# Altium project RK3566_.PrjPcb (part 4 of 6)
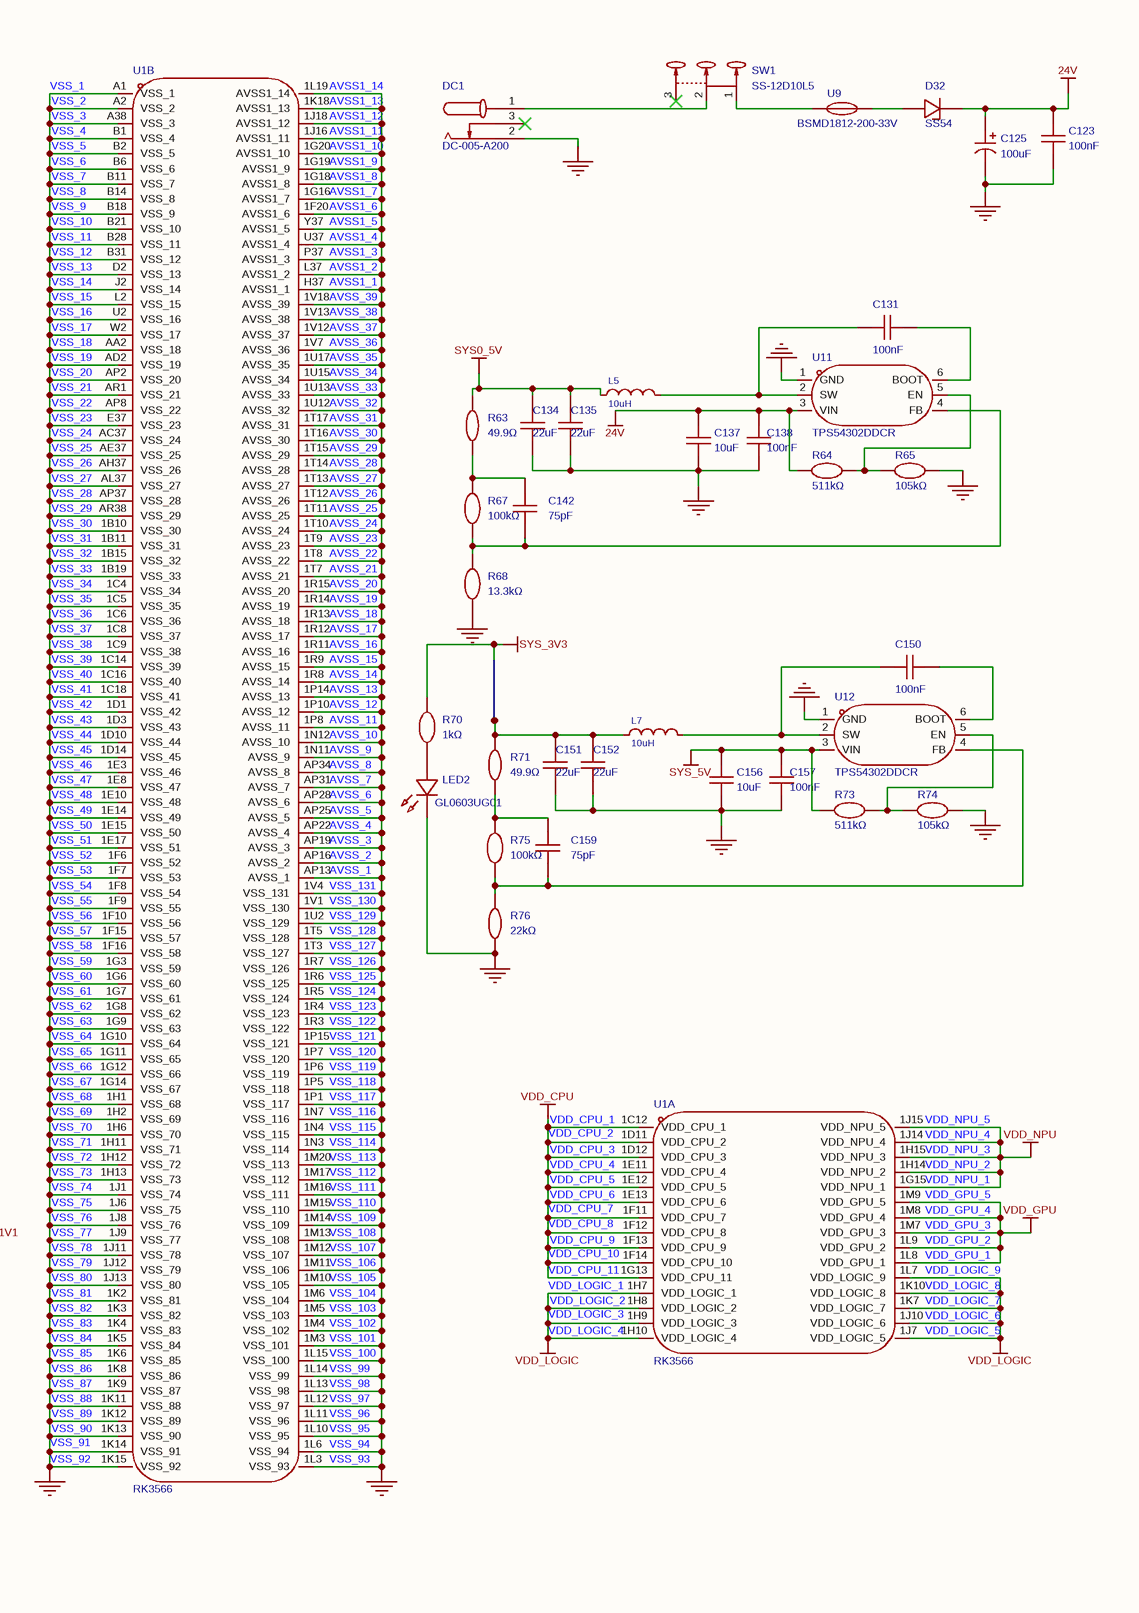
[diagram p112: 板载电源.schdoc, right]

## Sheet 板载电源.schdoc (continued)

### Library data of the parts
C120 C126 = FCC0402N180J500AT: 容值:18pF;精度:±5%;额定电压:50V;温度系数:C0G;; Manufacturer: FOJAN(富捷); AddInBom: yes; ModelId: 36a51122f27c49738f86b3bfa98863e0聨0819f05c4eef4c71ace90d822a990e87; ModelName: C0402_L1.0-W0.5-H0.5; ModelTransform: 39.37,19.685,0,0,0,0,0,0,0; Tolerance: ±5%; Voltage Rating: 50V; Temperature Coefficient: C0G; Symbol: FCC0402N180J500AT; Device: FCC0402N180J500AT; LCSC Part Name: 18pF ±5% 50V; SupplierPart: C5137554; ManufacturerPart: FCC0402N180J500AT; Supplier Footprint: 0402; JLCPCB Part Class: Extended Part; Datasheet: https://item.szlcsc.com/datasheet/FCC0402N180J500AT/5747006.html; Supplier: LCSC; ConvertToPcb: yes; FootprintName: C0402; Value: 18pF; Operating Temperature: -55℃~+125℃
C121 C124 C128 C130 C133 C139 C145 C154 C161 C165 C170 C175 C178 = HGC0402R5106M100NTEJ: as C118 on sheet WIFI_BT PHY; Symbol: HGC0402R5106M100NTEJ; Device: HGC0402R5106M100NTEJ; LCSC Part Name: 10uF ±20% 10V; Supplier Part: C7472949; Manufacturer Part: HGC0402R5106M100NTEJ; Supplier Footprint: 0402; JLCPCB Part Class: Extended Part; Datasheet: https://item.szlcsc.com/datasheet/HGC0402R5106M100NTEJ/8532796.html; Supplier: LCSC; Value: 10uF; ConvertToPcb: yes; FootprintName: C0402
C122 C132 C136 C140 C144 C147 C188 C190 = HGC0402R5105K500NTEJ: as C112 on sheet WIFI_BT PHY; Symbol: HGC0402R5105K500NTEJ; Device: HGC0402R5105K500NTEJ; LCSC Part Name: 1uF ±10% 50V; Supplier Part: C7472948; Manufacturer Part: HGC0402R5105K500NTEJ; Supplier Footprint: 0402; JLCPCB Part Class: Extended Part; Datasheet: https://item.szlcsc.com/datasheet/HGC0402R5105K500NTEJ/8532795.html; Supplier: LCSC; Value: 1uF; ConvertToPcb: yes; FootprintName: C0402
C123 = FCC0603B104K500CT: 容值:100nF;精度:±10%;额定电压:50V;温度系数:X7R;; Manufacturer: FOJAN(富捷); AddInBom: yes; ModelId: ac125912035d415993ca9572d50418b1聨0819f05c4eef4c71ace90d822a990e87; ModelName: C0603_L1.6-W0.8-H0.8; ModelTransform: 62.992,31.496,0,0,0,0,0,0,0; Tolerance: ±10%; Voltage Rating: 50V; Temperature Coefficient: X7R; Symbol: FCC0603B104K500CT; Device: FCC0603B104K500CT; LCSC Part Name: 100nF ±10% 50V; SupplierPart: C5137636; ManufacturerPart: FCC0603B104K500CT; Supplier Footprint: 0603; JLCPCB Part Class: Extended Part; Datasheet: https://item.szlcsc.com/datasheet/FCC0603B104K500CT/5747088.html; Supplier: LCSC; ConvertToPcb: yes; FootprintName: C0603; Value: 100nF; Operating Temperature: -55℃~+125℃
C125 = RVE100UF35V67RV0072: 容值:100uF;精度:±20%;额定电压:35V;纹波电流:230mA@120Hz;等效串联电阻(ESR):600mΩ@100kHz;; Manufacturer: KNSCHA(科尼盛); AddInBom: yes; ModelId: e9bf03a505e14561b78f20847edc0c03聨0819f05c4eef4c71ace90d822a990e87; ModelTransform: 283.464,259.842,0,180,0,0,0,0,0; Tolerance: ±20%; Voltage Rating: 35V; Lifetime: 2000hrs@105℃; Symbol: RVE100UF35V67RV0072; Device: RVE100UF35V67RV0072; LCSC Part Name: 100uF ±20% 35V; SupplierPart: C2836437; ManufacturerPart: RVE100UF35V67RV0072; Supplier Footprint: SMD,D6.3xL7.7mm; JLCPCB Part Class: Extended Part; Datasheet: https://item.szlcsc.com/datasheet/RVE100UF35V67RV0072/3002609.html; Supplier: LCSC; ConvertToPcb: yes; FootprintName: CAP-SMD_BD6.3-L6.6-W6.6-LS7.6-FD-1; ModelName: CAP-SMD_BD6.3-L6.6-W6.6-LS7.6-FD-1; Value: 100uF; Ripple Current: 230mA@120Hz; Equivalent Series Resistance(ESR): 600mΩ@100kHz; Diameter: 6.3mm; Height - Seated (Max): 7.7mm; Operating Temperature: -55℃~+105℃
C127 C129 = HGC0402R5106M100NTEJ: 容值:10uF;精度:±20%;额定电压:10V;温度系数:X5R;; Manufacturer: Chinocera(华瓷); AddInBom: yes; ModelId: 36a51122f27c49738f86b3bfa98863e0聨0819f05c4eef4c71ace90d822a990e87; ModelName: C0402_L1.0-W0.5-H0.5; ModelTransform: 39.37,19.685,0,0,0,0,0,0,0; Tolerance: ±20%; Voltage Rating: 10V; Temperature Coefficient: X5R; Symbol: HGC0402R5106M100NTEJ; Device: HGC0402R5106M100NTEJ; LCSC Part Name: 10uF ±20% 10V; SupplierPart: C7472949; ManufacturerPart: HGC0402R5106M100NTEJ; Supplier Footprint: 0402; JLCPCB Part Class: Extended Part; Datasheet: https://item.szlcsc.com/datasheet/HGC0402R5106M100NTEJ/8532796.html; Supplier: LCSC; ConvertToPcb: yes; FootprintName: C0402; Value: 10uF
C131 C138 C150 C157 = FCC0603B104K500CT: 容值:100nF;精度:±10%;额定电压:50V;温度系数:X7R;; Manufacturer: FOJAN(富捷); 3D Model: ac125912035d415993ca9572d50418b1聨0819f05c4eef4c71ace90d822a990e87; 3D Model Transform: 62.992,31.496,0,0,0,0,0,0,0; Tolerance: ±10%; Voltage Rating: 50V; Temperature Coefficient: X7R; AddInBom: yes; ModelName: C0603_L1.6-W0.8-H0.8; Symbol: FCC0603B104K500CT; Device: FCC0603B104K500CT; LCSC Part Name: 100nF ±10% 50V; Supplier Part: C5137636; Manufacturer Part: FCC0603B104K500CT; Supplier Footprint: 0603; JLCPCB Part Class: Extended Part; Datasheet: https://item.szlcsc.com/datasheet/FCC0603B104K500CT/5747088.html; Supplier: LCSC; Value: 100nF; Operating Temperature: -55℃~+125℃; ConvertToPcb: yes; FootprintName: C0603
C134 C135 C151 C152 = HGC0603R5226M100NTHJ: 容值:22uF;精度:±20%;额定电压:10V;温度系数:X5R;; Manufacturer: Chinocera(华瓷); AddInBom: yes; ModelId: ac125912035d415993ca9572d50418b1聨0819f05c4eef4c71ace90d822a990e87; ModelName: C0603_L1.6-W0.8-H0.8; ModelTransform: 62.992,31.496,0,0,0,0,0,0,0; Tolerance: ±20%; Voltage Rating: 10V; Temperature Coefficient: X5R; Symbol: HGC0603R5226M100NTHJ; Device: HGC0603R5226M100NTHJ; LCSC Part Name: 22uF ±20% 10V; SupplierPart: C7432770; ManufacturerPart: HGC0603R5226M100NTHJ; Supplier Footprint: 0603; JLCPCB Part Class: Extended Part; Datasheet: https://item.szlcsc.com/datasheet/HGC0603R5226M100NTHJ/8438252.html; Supplier: LCSC; ConvertToPcb: yes; FootprintName: C0603; Value: 22uF
C137 C156 = HGC0603R5106M350NTHJ: 容值:10uF;精度:±20%;额定电压:35V;温度系数:X5R;; Manufacturer: Chinocera(华瓷); AddInBom: yes; ModelId: ac125912035d415993ca9572d50418b1聨0819f05c4eef4c71ace90d822a990e87; ModelName: C0603_L1.6-W0.8-H0.8; ModelTransform: 62.992,31.496,0,0,0,0,0,0,0; Tolerance: ±20%; Voltage Rating: 35V; Temperature Coefficient: X5R; Symbol: HGC0603R5106M350NTHJ; Device: HGC0603R5106M350NTHJ; LCSC Part Name: 10uF ±20% 35V; SupplierPart: C22367827; ManufacturerPart: HGC0603R5106M350NTHJ; Supplier Footprint: 0603; JLCPCB Part Class: Extended Part; Datasheet: https://item.szlcsc.com/datasheet/HGC0603R5106M350NTHJ/23841132.html; Supplier: LCSC; ConvertToPcb: yes; FootprintName: C0603; Value: 10uF
C141 C143 C146 C158 C163 C164 C168 C172 C173 = CL05B104KO5NNNC: as C113 on sheet WIFI_BT PHY; Symbol: CL05B104KO5NNNC; Device: CL05B104KO5NNNC; LCSC Part Name: 100nF ±10% 16V; Supplier Part: C1525; Manufacturer Part: CL05B104KO5NNNC; Supplier Footprint: 0402; JLCPCB Part Class: Basic Part; Datasheet: https://item.szlcsc.com/datasheet/CL05B104KO5NNNC/1877.html; Supplier: LCSC; Value: 100nF; ConvertToPcb: yes; FootprintName: C0402
C142 C159 = CC0603JRNPO9BN750: 容值:75pF;精度:±5%;额定电压:50V;温度系数:NP0;; Manufacturer: YAGEO(国巨); AddInBom: yes; ModelId: ac125912035d415993ca9572d50418b1聨0819f05c4eef4c71ace90d822a990e87; ModelName: C0603_L1.6-W0.8-H0.8; ModelTransform: 62.992,31.496,0,0,0,0,0,0,0; Tolerance: ±5%; Voltage Rating: 50V; Temperature Coefficient: NP0; Symbol: CC0603JRNPO9BN750; Device: CC0603JRNPO9BN750; LCSC Part Name: 75pF ±5% 50V; SupplierPart: C282074; ManufacturerPart: CC0603JRNPO9BN750; Supplier Footprint: 0603; JLCPCB Part Class: Extended Part; Datasheet: https://item.szlcsc.com/datasheet/CC0603JRNPO9BN750/268161.html; Supplier: LCSC; ConvertToPcb: yes; FootprintName: C0603; Value: 75pF
C148 C149 = CL05A225MQ5NSNC: 容值:2.2uF;精度:±20%;额定电压:6.3V;温度系数:X5R;; Manufacturer: SAMSUNG(三星); AddInBom: yes; ModelId: 36a51122f27c49738f86b3bfa98863e0聨0819f05c4eef4c71ace90d822a990e87; ModelName: C0402_L1.0-W0.5-H0.5; ModelTransform: 39.37,19.685,0,0,0,0,0,0,0; Tolerance: ±20%; Voltage Rating: 6.3V; Temperature Coefficient: X5R; Symbol: CL05A225MQ5NSNC; Device: CL05A225MQ5NSNC; LCSC Part Name: 2.2uF ±20% 6.3V; SupplierPart: C12530; ManufacturerPart: CL05A225MQ5NSNC; Supplier Footprint: 0402; JLCPCB Part Class: Basic Part; Datasheet: https://item.szlcsc.com/datasheet/CL05A225MQ5NSNC/13164.html; Supplier: LCSC; ConvertToPcb: yes; FootprintName: C0402; Value: 2.2uF
C153 C160 C166 C167 C169 C174 C177 = HGC0603R5226M100NTHJ: 容值:22uF;精度:±20%;额定电压:10V;温度系数:X5R;; Manufacturer: Chinocera(华瓷); 3D Model: ac125912035d415993ca9572d50418b1聨0819f05c4eef4c71ace90d822a990e87; 3D Model Transform: 62.992,31.496,0,0,0,0,0,0,0; Tolerance: ±20%; Voltage Rating: 10V; Temperature Coefficient: X5R; AddInBom: yes; ModelName: C0603_L1.6-W0.8-H0.8; Symbol: HGC0603R5226M100NTHJ; Device: HGC0603R5226M100NTHJ; LCSC Part Name: 22uF ±20% 10V; Supplier Part: C7432770; Manufacturer Part: HGC0603R5226M100NTHJ; Supplier Footprint: 0603; JLCPCB Part Class: Extended Part; Datasheet: https://item.szlcsc.com/datasheet/HGC0603R5226M100NTHJ/8438252.html; Supplier: LCSC; Value: 22uF; ConvertToPcb: yes; FootprintName: C0603
C155 C162 C171 C176 C179 = CL05B104KO5NNNC: 容值:100nF;精度:±10%;额定电压:16V;温度系数:X7R;; Manufacturer: SAMSUNG(三星); AddInBom: yes; ModelId: 36a51122f27c49738f86b3bfa98863e0聨0819f05c4eef4c71ace90d822a990e87; ModelName: C0402_L1.0-W0.5-H0.5; ModelTransform: 39.37,19.685,0,0,0,0,0,0,0; Tolerance: ±10%; Voltage Rating: 16V; Temperature Coefficient: X7R; Symbol: CL05B104KO5NNNC; Device: CL05B104KO5NNNC; LCSC Part Name: 100nF ±10% 16V; SupplierPart: C1525; ManufacturerPart: CL05B104KO5NNNC; Supplier Footprint: 0402; JLCPCB Part Class: Basic Part; Datasheet: https://item.szlcsc.com/datasheet/CL05B104KO5NNNC/1877.html; Supplier: LCSC; ConvertToPcb: yes; FootprintName: C0402; Value: 100nF
C180-C187 C189 = HGC0402R5105K500NTEJ: 容值:1uF;精度:±10%;额定电压:50V;温度系数:X5R;; Manufacturer: Chinocera(华瓷); AddInBom: yes; ModelId: 36a51122f27c49738f86b3bfa98863e0聨0819f05c4eef4c71ace90d822a990e87; ModelName: C0402_L1.0-W0.5-H0.5; ModelTransform: 39.37,19.685,0,0,0,0,0,0,0; Tolerance: ±10%; Voltage Rating: 50V; Temperature Coefficient: X5R; Symbol: HGC0402R5105K500NTEJ; Device: HGC0402R5105K500NTEJ; LCSC Part Name: 1uF ±10% 50V; SupplierPart: C7472948; ManufacturerPart: HGC0402R5105K500NTEJ; Supplier Footprint: 0402; JLCPCB Part Class: Extended Part; Datasheet: https://item.szlcsc.com/datasheet/HGC0402R5105K500NTEJ/8532795.html; Supplier: LCSC; ConvertToPcb: yes; FootprintName: C0402; Value: 1uF
D32 = SS54_C7420369: 二极管配置:1个独立式;正向压降(Vf):550mV@5A;直流反向耐压(Vr):40V;整流电流:5A;; Manufacturer: R+O(宏嘉诚); AddInBom: yes; ModelId: 7e24bebe6cd74171ae8c9de6fc5b78aa聨0819f05c4eef4c71ace90d822a990e87; ModelTransform: 198.4248,103.5431,0,180,0,0,-0.001,0,0; Diode Configuration: 1个独立式; Voltage - DC Reverse(Vr): 40V; Current - Rectified: 5A; Reverse Leakage Current (Ir): 200uA@40V; Operating Junction Temperature Range: -55℃~+125℃; Non-Repetitive Peak Forward Surge Current: 120A; Symbol: SS54_C7420369; Device: SS54_C7420369; LCSC Part Name: 电压:40V 电流:5A; SupplierPart: C7420369; ManufacturerPart: SS54; Supplier Footprint: SMA(DO-214AC); JLCPCB Part Class: Extended Part; Datasheet: https://item.szlcsc.com/datasheet/SS54/8397191.html; Supplier: LCSC; ConvertToPcb: yes; FootprintName: SMA_L4.3-W2.6-LS5.0-FD; ModelName: SMA_L4.3-W2.6-LS5.0-FD; Voltage - Forward(Vf@If): 550mV@5A; Power Dissipation: -
D33 = BAT54CT-TP: 二极管配置:1对共阴极;正向压降(Vf):1V@100mA;直流反向耐压(Vr):30V;整流电流:200mA;; Manufacturer: MCC(美微科); AddInBom: yes; ModelId: 3e7fadd59d8d474faa89c2c7e0676879聨0819f05c4eef4c71ace90d822a990e87; ModelName: SOT-523-3P_L1.6-W0.8-H0.9-LS1.6-P0.50; ModelTransform: 63.48633,62.992,0,180,0,0,0,0,0; Diode Configuration: 1对共阴极; Voltage - DC Reverse(Vr): 30V; Current - Rectified: 200mA; Reverse Leakage Current (Ir): 2uA@25V; Symbol: BAT54CT-TP; Device: BAT54CT-TP; LCSC Part Name: 电压:30V 电流:200mA; SupplierPart: C725562; ManufacturerPart: BAT54CT-TP; Supplier Footprint: SOT-523-3; JLCPCB Part Class: Extended Part; Datasheet: https://item.szlcsc.com/datasheet/BAT54CT-TP/771875.html; Supplier: LCSC; ConvertToPcb: yes; FootprintName: SOT-523-3_L1.6-W0.8-P1.00-LS1.6-BR; Voltage - Forward(Vf@If): 1V@100mA
DC1 = DC-005-A200: 连接器类型:DC电源插座;安装方式:弯插;触点内径:2mm;触点外径:6.4mm;额定电流:3A;额定电压:30V;工作温度:-20℃~+70℃;; Manufacturer: XUNPU(讯普); AddInBom: yes; ModelId: 1321cdbe1dc84555a9684967491c8670聨0819f05c4eef4c71ace90d822a990e87; ModelTransform: 553.149,368.14887,0,0,0,0,-137.795,85.63,-161.417; Connector Type: DC电源插座; Inside Contact Diameter: 2mm; Outside Contact Diameter: 6.4mm; Current Rating: 3A; Voltage Rating (Max): 30V; Body Height: 11mm; Symbol: DC-005-A200; Device: DC-005-A200; LCSC Part Name: DC电源插座 内径:2mm 外径:6.4mm; SupplierPart: C720557; ManufacturerPart: DC-005-A200; Supplier Footprint: 插件; JLCPCB Part Class: Extended Part; Datasheet: https://item.szlcsc.com/datasheet/DC-005-A200/763564.html; Supplier: LCSC; ConvertToPcb: yes; FootprintName: DC-IN-TH_DC-005-A200; ModelName: DC-IN-TH_DC-005-A200; Mounting Type: 弯插; Length: 14mm; Width: 9mm; Operating Temperature: -20℃~+70℃
L5 L7 = PNR3015-100-M: 电感值:10uH;精度:±20%;额定电流:900mA;饱和电流(Isat):920mA;类型:磁胶屏蔽电感;; Manufacturer: JIERR(捷而瑞); AddInBom: yes; ModelId: 383ff80ba23841c7ae1294cf4d0706db聨0819f05c4eef4c71ace90d822a990e87; ModelTransform: 118.11,118.11394,0,0,0,0,-0.005,0,0; Tolerance: ±20%; Current Rating: 900mA; Current - Saturation(Isat): 920mA; DC Resistance(DCR): 250mΩ; Type: 磁胶屏蔽电感; Symbol: PNR3015-100-M; Device: PNR3015-100-M; LCSC Part Name: 10uH±20% 0.92A; SupplierPart: C55381747; ManufacturerPart: PNR3015-100-M; Supplier Footprint: SMD,3x3mm; JLCPCB Part Class: Extended Part; Datasheet: https://item.szlcsc.com/datasheet/PNR3015-100-M/59339375.html; Supplier: LCSC; ConvertToPcb: yes; FootprintName: IND-SMD_L3.0-W3.0_MAI3015S; ModelName: IND-SMD_L3.0-W3.0_MAI3015S; Value: 10uH
L6 L8 L10-L12 = PCT201210-R47-M: 小型化一体成型T-CORE，小体积，扁线工艺，感值小; Manufacturer: JIERR(捷而瑞); AddInBom: yes; Tolerance: ±20%; Current Rating: 3.8A; Current - Saturation(Isat): 4.7A; DC Resistance(DCR): 35mΩ; Type: 一体成型电感; Symbol: PCT201210-R47-M; Device: PCT201210-R47-M; LCSC Part Name: 0.47μH ±20% 4.7A; SupplierPart: C54557068; ManufacturerPart: PCT201210-R47-M; Supplier Footprint: 0805; JLCPCB Part Class: Extended Part; Datasheet: https://item.szlcsc.com/datasheet/PCT201210-R47-M/57921656.html; Supplier: LCSC; ConvertToPcb: yes; FootprintName: IND-SMD_L2.0-W1.2_PCT201210; Value: 470nH
L9 = FTC252010S4R7MBCA: 小型化一体成型T-CORE，小体积，扁线工艺，感值小; Manufacturer: cjiang(长江微电); AddInBom: yes; ModelId: e143e04106934774881cec608355723f聨0819f05c4eef4c71ace90d822a990e87; ModelTransform: 98.504,78.819,0,0,0,0,-0.004,-0.003,0; Symbol: FTC252010S4R7MBCA; Device: FTC252010S4R7MBCA; LCSC Part Name: 4.7uH ±20% 2.6A; SupplierPart: C5832360; ManufacturerPart: FTC252010S4R7MBCA; Supplier Footprint: 1008; JLCPCB Part Class: Extended Part; Datasheet: https://item.szlcsc.com/datasheet/FTC252010S4R7MBCA/6763480.html; Supplier: LCSC; ConvertToPcb: yes; FootprintName: IND-SMD_L2.5-W2.0-VLS252012CX-150M; ModelName: IND-SMD_L2.5-W2.0-VLS252012CX-150M
LED2 = GL0603UG01: 灯头类型:-;发光颜色:翠绿色;正向压降(Vf):2.7V~3.2V;功率:-;测试电流:20mA;波长:510nm~531nm;二极管配置:独立二极管;透镜颜色:无色透明透镜;色温:-;发光强度:173mcd~350mcd;发光角度:120°;载带方式:正贴;工作温度:-40℃~+85℃;; Manufacturer: Guiguang light(桂光光电); AddInBom: yes; ModelId: 1f0d29a91be547639d425604e9b96ebb聨0819f05c4eef4c71ace90d822a990e87; ModelTransform: 63.7794,32.283,0,0,0,0,0,0,0; Illumination Color: 翠绿色; Test Current: 20mA; Diode Configuration: 独立二极管; Lens Color: 无色透明透镜; Viewing Angle: 120°; Symbol: GL0603UG01; Device: GL0603UG01; LCSC Part Name: 0603 翠绿 高亮; SupplierPart: C51933293; ManufacturerPart: GL0603UG01; Supplier Footprint: 0603; JLCPCB Part Class: Extended Part; Datasheet: https://item.szlcsc.com/datasheet/GL0603UG01/54645989.html; Supplier: LCSC; ConvertToPcb: yes; FootprintName: LED0603-RD; ModelName: LED0603-RD; Lamp Holder Type: -; Voltage - Forward(Vf): 2.7V~3.2V; Power(Watts): -; Wavelength - Dominant: 510nm~531nm; Peak Wavelength: -; Color Temperature: -; Luminous Intensity: 173mcd~350mcd; Mounting Style: 正贴; Operating Temperature: -40℃~+85℃
R57 R66 R69 = FRC0402F1002TS: as R56 on sheet WIFI_BT PHY; Symbol: FRC0402F1002TS; Device: FRC0402F1002TS; LCSC Part Name: 10kΩ ±1% 62.5mW 厚膜电阻; SupplierPart: C2906861; ManufacturerPart: FRC0402F1002TS; Supplier Footprint: 0402; JLCPCB Part Class: Extended Part; Datasheet: https://item.szlcsc.com/datasheet/FRC0402F1002TS/3180374.html; Supplier: LCSC; ConvertToPcb: yes; FootprintName: R0402; Type: 厚膜电阻; Value: 10kΩ; Temperature Coefficient: ±100ppm/℃; Operating Temperature: -55℃~+155℃
R58 = RC0402FR-0722RL: 电阻类型:厚膜电阻;阻值:22Ω;精度:±1%;功率:62.5mW;工作电压:50V;温度系数:±100ppm/℃;; Manufacturer: YAGEO(国巨); AddInBom: yes; ModelId: 98c88bc2b9094f218f3a3e30a7012738聨0819f05c4eef4c71ace90d822a990e87; ModelName: R0402_L1.0-W0.5-H0.4; ModelTransform: 39.37,19.685,0,0,0,0,0,0,0; Tolerance: ±1%; Power(Watts): 62.5mW; Voltage-Supply(Max): 50V; Symbol: RC0402FR-0722RL; Device: RC0402FR-0722RL; LCSC Part Name: 厚膜电阻 22Ω ±1% 62.5mW; SupplierPart: C114765; ManufacturerPart: RC0402FR-0722RL; Supplier Footprint: 0402; JLCPCB Part Class: Extended Part; Datasheet: https://item.szlcsc.com/datasheet/RC0402FR-0722RL/116009.html; Supplier: LCSC; ConvertToPcb: yes; FootprintName: R0402; Type: 厚膜电阻; Value: 22Ω; Temperature Coefficient: ±100ppm/℃; Operating Temperature: -55℃~+155℃
R59 R79 R83 = FRC0402F1002TS: 电阻类型:厚膜电阻;阻值:10kΩ;精度:±1%;功率:62.5mW;工作电压:50V;温度系数:±100ppm/℃;; Manufacturer: FOJAN(富捷); 3D Model: 98c88bc2b9094f218f3a3e30a7012738聨0819f05c4eef4c71ace90d822a990e87; 3D Model Transform: 39.37,19.685,0,0,0,0,0,0,0; Tolerance: ±1%; Power(Watts): 62.5mW; Voltage-Supply(Max): 50V; AddInBom: yes; ModelName: R0402_L1.0-W0.5-H0.4; Symbol: FRC0402F1002TS; Device: FRC0402F1002TS; LCSC Part Name: 10kΩ ±1% 62.5mW 厚膜电阻; Supplier Part: C2906861; Manufacturer Part: FRC0402F1002TS; Supplier Footprint: 0402; JLCPCB Part Class: Extended Part; Datasheet: https://item.szlcsc.com/datasheet/FRC0402F1002TS/3180374.html; Supplier: LCSC; Type: 厚膜电阻; Value: 10kΩ; Temperature Coefficient: ±100ppm/℃; Operating Temperature: -55℃~+155℃; ConvertToPcb: yes; FootprintName: R0402
R60 R61 = 0402WGF1000TCE: 电阻类型:厚膜电阻;阻值:100Ω;精度:±1%;功率:62.5mW;工作电压:50V;温度系数:±100ppm/℃;; Manufacturer: UNI-ROYAL(厚声); AddInBom: yes; ModelId: 98c88bc2b9094f218f3a3e30a7012738聨0819f05c4eef4c71ace90d822a990e87; ModelName: R0402_L1.0-W0.5-H0.4; ModelTransform: 39.37,19.685,0,0,0,0,0,0,0; Tolerance: ±1%; Power(Watts): 62.5mW; Voltage-Supply(Max): 50V; Symbol: 0402WGF1000TCE; Device: 0402WGF1000TCE; LCSC Part Name: 厚膜电阻 100Ω ±1%; SupplierPart: C25076; ManufacturerPart: 0402WGF1000TCE; Supplier Footprint: 0402; JLCPCB Part Class: Basic Part; Datasheet: https://item.szlcsc.com/datasheet/0402WGF1000TCE/25819.html; Supplier: LCSC; ConvertToPcb: yes; FootprintName: R0402; Type: 厚膜电阻; Value: 100Ω; Temperature Coefficient: ±100ppm/℃; Operating Temperature: -55℃~+155℃
R62 = FRC0402F6802TS: 电阻类型:厚膜电阻;阻值:68kΩ;精度:±1%;功率:62.5mW;工作电压:50V;温度系数:±100ppm/℃;; Manufacturer: FOJAN(富捷); AddInBom: yes; ModelId: 98c88bc2b9094f218f3a3e30a7012738聨0819f05c4eef4c71ace90d822a990e87; ModelName: R0402_L1.0-W0.5-H0.4; ModelTransform: 39.37,19.685,0,0,0,0,0,0,0; Tolerance: ±1%; Power(Watts): 62.5mW; Voltage-Supply(Max): 50V; Symbol: FRC0402F6802TS; Device: FRC0402F6802TS; LCSC Part Name: 68kΩ ±1% 62.5mW 厚膜电阻; SupplierPart: C2909379; ManufacturerPart: FRC0402F6802TS; Supplier Footprint: 0402; JLCPCB Part Class: Extended Part; Datasheet: https://item.szlcsc.com/datasheet/FRC0402F6802TS/3186314.html; Supplier: LCSC; ConvertToPcb: yes; FootprintName: R0402; Type: 厚膜电阻; Value: 68kΩ; Temperature Coefficient: ±100ppm/℃; Operating Temperature: -55℃~+155℃
R63 R71 = 0603WAF499JT5E: 电阻类型:厚膜电阻;阻值:49.9Ω;精度:±1%;功率:100mW;工作电压:75V;温度系数:±100ppm/℃;; Manufacturer: UNI-ROYAL(厚声); AddInBom: yes; ModelId: fc143cca1e79419f9cd78b61e9279f08聨0819f05c4eef4c71ace90d822a990e87; ModelTransform: 31.8897,63.7794,0,90,0,0,0,0,0; Tolerance: ±1%; Power(Watts): 100mW; Voltage-Supply(Max): 75V; Symbol: 0603WAF499JT5E; Device: 0603WAF499JT5E; LCSC Part Name: 49.9Ω ±1% 100mW 厚膜电阻; SupplierPart: C23185; ManufacturerPart: 0603WAF499JT5E; Supplier Footprint: 0603; JLCPCB Part Class: Basic Part; Datasheet: https://item.szlcsc.com/datasheet/0603WAF499JT5E/23912.html; Supplier: LCSC; ConvertToPcb: yes; FootprintName: R0603; ModelName: R0603; Type: 厚膜电阻; Value: 49.9Ω; Temperature Coefficient: ±100ppm/℃; Operating Temperature: -55℃~+155℃
R64 R73 = ERJ3EKF5113V: 电阻类型:厚膜电阻;阻值:511kΩ;精度:±1%;功率:100mW;工作电压:75V;温度系数:±100ppm/℃;; Manufacturer: PANASONIC(松下); AddInBom: yes; ModelId: fc143cca1e79419f9cd78b61e9279f08聨0819f05c4eef4c71ace90d822a990e87; ModelTransform: 31.8897,63.7794,0,90,0,0,0,0,0; Tolerance: ±1%; Power(Watts): 100mW; Voltage-Supply(Max): 75V; Symbol: ERJ3EKF5113V; Device: ERJ3EKF5113V; LCSC Part Name: 厚膜电阻 511kΩ ±1% 100mW; SupplierPart: C403259; ManufacturerPart: ERJ3EKF5113V; Supplier Footprint: 0603; JLCPCB Part Class: Extended Part; Datasheet: https://item.szlcsc.com/datasheet/ERJ3EKF5113V/389058.html; Supplier: LCSC; ConvertToPcb: yes; FootprintName: R0603; ModelName: R0603; Type: 厚膜电阻; Value: 511kΩ; Temperature Coefficient: ±100ppm/℃; Operating Temperature: -55℃~+155℃
R65 R74 = FRC0603F1053TS: 电阻类型:厚膜电阻;阻值:105kΩ;精度:±1%;功率:100mW;工作电压:75V;温度系数:±100ppm/℃;; Manufacturer: FOJAN(富捷); AddInBom: yes; ModelId: fc143cca1e79419f9cd78b61e9279f08聨0819f05c4eef4c71ace90d822a990e87; ModelTransform: 31.8897,63.7794,0,90,0,0,0,0,0; Tolerance: ±1%; Power(Watts): 100mW; Voltage-Supply(Max): 75V; Symbol: FRC0603F1053TS; Device: FRC0603F1053TS; LCSC Part Name: 105kΩ ±1% 100mW 厚膜电阻; SupplierPart: C2933128; ManufacturerPart: FRC0603F1053TS; Supplier Footprint: 0603; JLCPCB Part Class: Extended Part; Supplier: LCSC; ConvertToPcb: yes; FootprintName: R0603; ModelName: R0603; Type: 厚膜电阻; Value: 105kΩ; Temperature Coefficient: ±100ppm/℃; Operating Temperature: -55℃~+155℃
R67 R75 = FRC0603F1003TS: 电阻类型:厚膜电阻;阻值:100kΩ;精度:±1%;功率:100mW;工作电压:75V;温度系数:±100ppm/℃;; Manufacturer: FOJAN(富捷); AddInBom: yes; ModelId: fc143cca1e79419f9cd78b61e9279f08聨0819f05c4eef4c71ace90d822a990e87; ModelTransform: 31.8897,63.7794,0,90,0,0,0,0,0; Tolerance: ±1%; Power(Watts): 100mW; Voltage-Supply(Max): 75V; Symbol: FRC0603F1003TS; Device: FRC0603F1003TS; LCSC Part Name: 100kΩ ±1% 100mW 厚膜电阻; SupplierPart: C2906980; ManufacturerPart: FRC0603F1003TS; Supplier Footprint: 0603; JLCPCB Part Class: Extended Part; Datasheet: https://item.szlcsc.com/datasheet/FRC0603F1003TS/3180493.html; Supplier: LCSC; ConvertToPcb: yes; FootprintName: R0603; ModelName: R0603; Type: 厚膜电阻; Value: 100kΩ; Temperature Coefficient: ±100ppm/℃; Operating Temperature: -55℃~+155℃
R68 = FRC0603F1332TS: 电阻类型:厚膜电阻;阻值:13.3kΩ;精度:±1%;功率:100mW;工作电压:75V;温度系数:±100ppm/℃;; Manufacturer: FOJAN(富捷); AddInBom: yes; ModelId: fc143cca1e79419f9cd78b61e9279f08聨0819f05c4eef4c71ace90d822a990e87; ModelTransform: 31.8897,63.7794,0,90,0,0,0,0,0; Tolerance: ±1%; Power(Watts): 100mW; Voltage-Supply(Max): 75V; Symbol: FRC0603F1332TS; Device: FRC0603F1332TS; LCSC Part Name: 13.3kΩ ±1% 100mW 厚膜电阻; SupplierPart: C2933140; ManufacturerPart: FRC0603F1332TS; Supplier Footprint: 0603; JLCPCB Part Class: Extended Part; Supplier: LCSC; ConvertToPcb: yes; FootprintName: R0603; ModelName: R0603; Type: 厚膜电阻; Value: 13.3kΩ; Temperature Coefficient: ±100ppm/℃; Operating Temperature: -55℃~+155℃
R70 = FRC0603F1001TS: 电阻类型:厚膜电阻;阻值:1kΩ;精度:±1%;功率:100mW;工作电压:75V;温度系数:±100ppm/℃;; Manufacturer: FOJAN(富捷); AddInBom: yes; ModelId: fc143cca1e79419f9cd78b61e9279f08聨0819f05c4eef4c71ace90d822a990e87; ModelTransform: 31.8897,63.7794,0,90,0,0,0,0,0; Tolerance: ±1%; Power(Watts): 100mW; Voltage-Supply(Max): 75V; Symbol: FRC0603F1001TS; Device: FRC0603F1001TS; LCSC Part Name: 1kΩ ±1% 100mW 厚膜电阻; SupplierPart: C2907002; ManufacturerPart: FRC0603F1001TS; Supplier Footprint: 0603; JLCPCB Part Class: Extended Part; Datasheet: https://item.szlcsc.com/datasheet/FRC0603F1001TS/3180515.html; Supplier: LCSC; ConvertToPcb: yes; FootprintName: R0603; ModelName: R0603; Type: 厚膜电阻; Value: 1kΩ; Temperature Coefficient: ±100ppm/℃; Operating Temperature: -55℃~+155℃
R72 R77 R82 R85 = FRC0402F1000TS: 电阻类型:厚膜电阻;阻值:100Ω;精度:±1%;功率:62.5mW;工作电压:50V;温度系数:±100ppm/℃;; Manufacturer: FOJAN(富捷); AddInBom: yes; ModelId: 98c88bc2b9094f218f3a3e30a7012738聨0819f05c4eef4c71ace90d822a990e87; ModelName: R0402_L1.0-W0.5-H0.4; ModelTransform: 39.37,19.685,0,0,0,0,0,0,0; Tolerance: ±1%; Power(Watts): 62.5mW; Voltage-Supply(Max): 50V; Symbol: FRC0402F1000TS; Device: FRC0402F1000TS; LCSC Part Name: 100Ω ±1% 62.5mW 厚膜电阻; SupplierPart: C2906860; ManufacturerPart: FRC0402F1000TS; Supplier Footprint: 0402; JLCPCB Part Class: Extended Part; Datasheet: https://item.szlcsc.com/datasheet/FRC0402F1000TS/3180373.html; Supplier: LCSC; ConvertToPcb: yes; FootprintName: R0402; Type: 厚膜电阻; Value: 100Ω; Temperature Coefficient: ±100ppm/℃; Operating Temperature: -55℃~+155℃
R76 = 0603WAF2202T5E: 电阻类型:厚膜电阻;阻值:22kΩ;精度:±1%;功率:100mW;工作电压:75V;温度系数:±100ppm/℃;; Manufacturer: UNI-ROYAL(厚声); AddInBom: yes; ModelId: fc143cca1e79419f9cd78b61e9279f08聨0819f05c4eef4c71ace90d822a990e87; ModelTransform: 31.8897,63.7794,0,90,0,0,0,0,0; Tolerance: ±1%; Power(Watts): 100mW; Voltage-Supply(Max): 75V; Symbol: 0603WAF2202T5E; Device: 0603WAF2202T5E; LCSC Part Name: 22kΩ ±1% 100mW 厚膜电阻; SupplierPart: C31850; ManufacturerPart: 0603WAF2202T5E; Supplier Footprint: 0603; JLCPCB Part Class: Basic Part; Datasheet: https://item.szlcsc.com/datasheet/0603WAF2202T5E/32812.html; Supplier: LCSC; ConvertToPcb: yes; FootprintName: R0603; ModelName: R0603; Type: 厚膜电阻; Value: 22kΩ; Temperature Coefficient: ±100ppm/℃; Operating Temperature: -55℃~+155℃
R78 = 0402WGF0000TCE: 电阻类型:厚膜电阻;阻值:0Ω;精度:±1%;功率:62.5mW;工作电压:50V;温度系数:±800ppm/℃;; Manufacturer: UNI-ROYAL(厚声); AddInBom: yes; ModelId: 98c88bc2b9094f218f3a3e30a7012738聨0819f05c4eef4c71ace90d822a990e87; ModelName: R0402_L1.0-W0.5-H0.4; ModelTransform: 39.37,19.685,0,0,0,0,0,0,0; Tolerance: ±1%; Power(Watts): 62.5mW; Voltage-Supply(Max): 50V; Symbol: 0402WGF0000TCE; Device: 0402WGF0000TCE; LCSC Part Name: 厚膜电阻 0Ω ±1%; SupplierPart: C17168; ManufacturerPart: 0402WGF0000TCE; Supplier Footprint: 0402; JLCPCB Part Class: Basic Part; Datasheet: https://item.szlcsc.com/datasheet/0402WGF0000TCE/17853.html; Supplier: LCSC; ConvertToPcb: yes; FootprintName: R0402; Type: 厚膜电阻; Value: 0Ω; Temperature Coefficient: ±800ppm/℃; Operating Temperature: -55℃~+155℃
R80 = FRC0402F4022TS: 电阻类型:厚膜电阻;阻值:40.2kΩ;精度:±1%;功率:62.5mW;工作电压:50V;温度系数:±100ppm/℃;; Manufacturer: FOJAN(富捷); AddInBom: yes; ModelId: 98c88bc2b9094f218f3a3e30a7012738聨0819f05c4eef4c71ace90d822a990e87; ModelName: R0402_L1.0-W0.5-H0.4; ModelTransform: 39.37,19.685,0,0,0,0,0,0,0; Tolerance: ±1%; Power(Watts): 62.5mW; Voltage-Supply(Max): 50V; Symbol: FRC0402F4022TS; Device: FRC0402F4022TS; LCSC Part Name: 40.2kΩ ±1% 62.5mW 厚膜电阻; SupplierPart: C2933097; ManufacturerPart: FRC0402F4022TS; Supplier Footprint: 0402; JLCPCB Part Class: Extended Part; Datasheet: https://item.szlcsc.com/datasheet/FRC0402F4022TS/3279199.html; Supplier: LCSC; ConvertToPcb: yes; FootprintName: R0402; Type: 厚膜电阻; Value: 40.2kΩ; Temperature Coefficient: ±100ppm/℃; Operating Temperature: -55℃~+155℃
R81 = FRC0402F1003TS: 电阻类型:厚膜电阻;阻值:100kΩ;精度:±1%;功率:62.5mW;工作电压:50V;温度系数:±100ppm/℃;; Manufacturer: FOJAN(富捷); AddInBom: yes; ModelId: 98c88bc2b9094f218f3a3e30a7012738聨0819f05c4eef4c71ace90d822a990e87; ModelName: R0402_L1.0-W0.5-H0.4; ModelTransform: 39.37,19.685,0,0,0,0,0,0,0; Tolerance: ±1%; Power(Watts): 62.5mW; Voltage-Supply(Max): 50V; Symbol: FRC0402F1003TS; Device: FRC0402F1003TS; LCSC Part Name: 100kΩ ±1% 62.5mW 厚膜电阻; SupplierPart: C2906859; ManufacturerPart: FRC0402F1003TS; Supplier Footprint: 0402; JLCPCB Part Class: Extended Part; Datasheet: https://item.szlcsc.com/datasheet/FRC0402F1003TS/3180372.html; Supplier: LCSC; ConvertToPcb: yes; FootprintName: R0402; Type: 厚膜电阻; Value: 100kΩ; Temperature Coefficient: ±100ppm/℃; Operating Temperature: -55℃~+155℃
R84 = 0402WGF1003TCE: 电阻类型:厚膜电阻;阻值:100kΩ;精度:±1%;功率:62.5mW;工作电压:50V;温度系数:±100ppm/℃;; Manufacturer: UNI-ROYAL(厚声); AddInBom: yes; ModelId: 98c88bc2b9094f218f3a3e30a7012738聨0819f05c4eef4c71ace90d822a990e87; ModelName: R0402_L1.0-W0.5-H0.4; ModelTransform: 39.37,19.685,0,0,0,0,0,0,0; Tolerance: ±1%; Power(Watts): 62.5mW; Voltage-Supply(Max): 50V; Symbol: 0402WGF1003TCE; Device: 0402WGF1003TCE; LCSC Part Name: 厚膜电阻 100kΩ ±1%; SupplierPart: C25741; ManufacturerPart: 0402WGF1003TCE; Supplier Footprint: 0402; JLCPCB Part Class: Basic Part; Datasheet: https://item.szlcsc.com/datasheet/0402WGF1003TCE/26484.html; Supplier: LCSC; ConvertToPcb: yes; FootprintName: R0402; Type: 厚膜电阻; Value: 100kΩ; Temperature Coefficient: ±100ppm/℃; Operating Temperature: -55℃~+155℃
SW1 = SS-12D10L5: 电路结构:单刀双掷;安装方式:直插;开关颜色:黑色;额定电流:3A;额定电压:125V;工作寿命:1万次;; Manufacturer: XKB Connection(中国星坤); AddInBom: yes; ModelId: c49f07a32c154ec8ad7cf47670a53981聨0819f05c4eef4c71ace90d822a990e87; ModelName: SW-TH_L13.0-W6.8-H6.4-P4.7; ModelTransform: 511.81394,267.716,0,0,0,0,0,0,-220.472; Circuit: 单刀双掷; Actuator Style: 矩形柱状; Switch Height: 6.4mm; Actuator Color: 黑色; Current Rating: 3A; Voltage Rating: 125V; Life: 1万次; Symbol: SS-12D10L5; Device: SS-12D10L5; LCSC Part Name: 柄长5mm 直插双档 滑动开关; SupplierPart: C319012; ManufacturerPart: SS-12D10L5; Supplier Footprint: 插件,13x6.8mm; JLCPCB Part Class: Extended Part; Datasheet: https://item.szlcsc.com/datasheet/SS-12D10L5/300104.html; Supplier: LCSC; ConvertToPcb: yes; FootprintName: SW-TH_SS-12D10L5; Termination Style: PC引脚; Length: 13mm; Width: 6.8mm; Mounting Type: 直插; Operating Temperature: -40℃~+85℃
SW2 = KH-6X6X5H-STM: 电路结构:单刀单掷;按钮形状:圆形按钮;安装方式:立贴;开关长度:6mm;开关宽度:6mm;开关高度:5mm;带支架:不带支架;触点电流:50mA;额定电压:12V;工作寿命:8万次;; Manufacturer: kinghelm(金航标); 3D Model: 46371efb35684031937580a0045530ec聨0819f05c4eef4c71ace90d822a990e87; 3D Model Transform: 354.33,236.25937,0,0,0,0,0,0,0; Circuit: 单刀单掷; Actuator Style: 圆形按钮; Switch Height: 5mm; with Bracket: 不带支架; Contact Current: 50mA; Voltage Rating: 12V; Actuator/Cap Color: 黑色; Life: 8万次; AddInBom: yes; Symbol: KH-6X6X5H-STM; Device: KH-6X6X5H-STM; LCSC Part Name: 6*6*5mm 立贴 轻触开关; Supplier Part: C2837531; Manufacturer Part: KH-6X6X5H-STM; Supplier Footprint: SMD-4P,6x6mm; JLCPCB Part Class: Extended Part; Datasheet: https://item.szlcsc.com/datasheet/KH-6X6X5H-STM/3009601.html; Supplier: LCSC; Mounting Type: 立贴; Length: 6mm; Width: 6mm; Termination Style: 鸥翼型; ConvertToPcb: yes; FootprintName: SW-SMD_4P-L6.0-W6.0-P4.50-LS9.0_H5.0; ModelName: SW-SMD_4P-L6.0-W6.0-P4.50-LS9.0_H5.0
SW3 = KH-6X6X5H-STM: 电路结构:单刀单掷;按钮形状:圆形按钮;安装方式:立贴;开关长度:6mm;开关宽度:6mm;开关高度:5mm;带支架:不带支架;触点电流:50mA;额定电压:12V;工作寿命:8万次;; Manufacturer: kinghelm(金航标); AddInBom: yes; ModelId: 46371efb35684031937580a0045530ec聨0819f05c4eef4c71ace90d822a990e87; ModelTransform: 354.33,236.25937,0,0,0,0,0,0,0; Circuit: 单刀单掷; Actuator Style: 圆形按钮; Switch Height: 5mm; with Bracket: 不带支架; Contact Current: 50mA; Voltage Rating: 12V; Actuator/Cap Color: 黑色; Life: 8万次; Symbol: KH-6X6X5H-STM; Device: KH-6X6X5H-STM; LCSC Part Name: 6*6*5mm 立贴 轻触开关; SupplierPart: C2837531; ManufacturerPart: KH-6X6X5H-STM; Supplier Footprint: SMD-4P,6x6mm; JLCPCB Part Class: Extended Part; Datasheet: https://item.szlcsc.com/datasheet/KH-6X6X5H-STM/3009601.html; Supplier: LCSC; ConvertToPcb: yes; FootprintName: SW-SMD_4P-L6.0-W6.0-P4.50-LS9.0_H5.0; ModelName: SW-SMD_4P-L6.0-W6.0-P4.50-LS9.0_H5.0; Mounting Type: 立贴; Length: 6mm; Width: 6mm; Termination Style: 鸥翼型
U1 = RK3566: 是一款高性能、低功耗的四核应用处理器，专为个人移动互联网设备和AIoT设备设计。提供了许多嵌入式强大硬件引擎，以优化高端应用的性能。支持几乎全格式的H.264 4K@60fps解码器、H.265 4K@60fps解码器，还支持H.264/H.265 1080p@60fps编码器、高质量JPEG编码器/解码器。嵌入式3D GPU使其完全兼容OpenGL ES 1.1/2.0/3.2、OpenCL 2.0和Vulkan 1.1; Manufacturer: Rockchip(瑞芯微); Relevance: []; AddInBom: yes; ModelId: 096be4498db445d8b521581a084e15ec聨0819f05c4eef4c71ace90d822a990e87; ModelTransform: 610.235,566.928,0,0,0,0,0,0,0; Symbol: RK3566; Device: RK3566; LCSC Part Name: 表面贴装型开关全行程、动作力等性能; SupplierPart: C2943786; ManufacturerPart: RK3566; Supplier Footprint: BGA-565(15.5x14.4); JLCPCB Part Class: Extended Part; Datasheet: https://item.szlcsc.com/datasheet/RK3566/3329057.html; Supplier: LCSC; ConvertToPcb: yes; FootprintName: BGA-565_L15.5-W14.4-P0.40_RK3566_1; ModelName: BGA-565_L15.5-W14.4-P0.40_RK3566_1
U8 = RK809-5: Manufacturer: Rockchip(瑞芯微); AddInBom: yes; ModelId: e930c577e1fa4bd28a96171513c1b833聨0819f05c4eef4c71ace90d822a990e87; ModelName: QFN-68_L7.0-W7.0-H0.8-P0.35-BL-EP5.5; ModelTransform: 275.591,275.591,0,0,0,0,0,0,0; Interface: I2C; Input Voltage: 2.7V~5.5V; Output Voltage: 0.5V~3.4V；0.6V~3.4V；1.5V~3.6V；0.5V~2.4V; Output Current: 2.5A; Symbol: RK809-5; Device: RK809-5; LCSC Part Name: RK809-5; SupplierPart: C2939628; ManufacturerPart: RK809-5; Supplier Footprint: QFN-68-EP(7x7); JLCPCB Part Class: Extended Part; Datasheet: https://item.szlcsc.com/datasheet/RK809-5/3300621.html; Supplier: LCSC; ConvertToPcb: yes; FootprintName: QFN-68_L7.0-W7.0-P0.35-BL-EP5.5; Features: 上电时序控制；动态电压调节; Operating Temperature: -40℃~+125℃
U9 = BSMD1812-200-33V: 耐压(Vmax):33V;最大电流(Imax):40A;保持电流(Ihold):2A;跳闸电流(Itrip):4A;; Manufacturer: BHFUSE(佰宏); AddInBom: yes; ModelId: bca21e458c564d38b781621ca22e660b聨0819f05c4eef4c71ace90d822a990e87; ModelName: F1812_L4.5-W3.2-H1.0; ModelTransform: 177.165,125.984,0,0,0,0,0.0005,0,0; Voltage - Max: 33V; Current - Max: 40A; Hold Current: 2A; Trip Current: 4A; Power Dissipation: 1W; Resistance - Initial (Ri) (Min): 20mΩ; Resistance - Post Trip (R1) (Max): 100mΩ; Time to Trip(Max): 2s; Symbol: BSMD1812-200-33V; Device: BSMD1812-200-33V; LCSC Part Name: 1812 2A 33V 自恢复; SupplierPart: C7433877; ManufacturerPart: BSMD1812-200-33V; Supplier Footprint: 1812; JLCPCB Part Class: Extended Part; Datasheet: https://item.szlcsc.com/datasheet/BSMD1812-200-33V/8443524.html; Supplier: LCSC; ConvertToPcb: yes; FootprintName: F1812; Operating Temperature: -40℃~+85℃; Length: 4.73mm; Width: 3.41mm; Height: 1.5mm; Pitch: -
U10 = XDCR-1220-006: 连接器类型:电池底座;适用电池规格:CR1220;触头材质:-;触头镀层:金;工作温度:-40℃~+85℃;; Manufacturer: LX(连欣科技); AddInBom: yes; ModelId: aa69efc108b9406287881e5b236f6e7a聨0819f05c4eef4c71ace90d822a990e87; ModelName: BAT-SMD_CR1220-2; ModelTransform: 777.81069,586.46209,0,180,0,0,-19.685,0,-31.496; Connector Type: 电池底座; Battery Type: CR1220; Symbol: XDCR-1220-006; Device: XDCR-1220-006; LCSC Part Name: 电池座CR1220贴片式镀金 电池底座配套电池型号：CR1220-3V; SupplierPart: C7498147; ManufacturerPart: XDCR-1220-006; Supplier Footprint: SMD; JLCPCB Part Class: Extended Part; Datasheet: https://item.szlcsc.com/datasheet/XDCR-1220-006/8568589.html; Supplier: LCSC; ConvertToPcb: yes; FootprintName: BAT-SMD_CR1220-2ZX; Contact Material: -; Contact Plating: 金; Operating Temperature: -40℃~+85℃
U11 U12 = TPS54302DDCR: 功能类型:降压型;工作电压:4.5V~28V;输出电压:-;输出电流:3A;输出类型:可调;; Manufacturer: TI(德州仪器); Symbol: TPS54302DDCR_C311983; AddInBom: yes; ModelId: 18da8f6c14a34920b3e136b5c401a119聨0819f05c4eef4c71ace90d822a990e87; ModelName: SOT-23-6_L2.9-W1.6-H1.5-LS2.8-P0.95; ModelTransform: 110.236,113.364,0,90,0,0,0.0005,0.0005,0; Function: 降压型; Output Current: 3A; Frequency - Switching: 400kHz; Synchronous Rectifier: 是; Number of Outputs: 1; Topology: 降压式; Quiescent Current: 45uA; Switch tube (built-in/external): 内置; Output Type: 可调; Device: TPS54302DDCR; LCSC Part Name: 降压型 3A 4.5V~28V; SupplierPart: C311983; ManufacturerPart: TPS54302DDCR; Supplier Footprint: TSOT-23-6; JLCPCB Part Class: Extended Part; Datasheet: https://www.ti.com/cn/lit/ds/symlink/tps54302.pdf; Supplier: LCSC; ConvertToPcb: yes; FootprintName: SOT-23-6_L2.9-W1.6-P0.95-LS2.8-BL; Voltage - Supply: 4.5V~28V; Output Voltage: -; Operating Temperature: -40℃~+125℃@(TJ); Features: 轻载高效模式；逐波限流；过流保护；EMI优化(抖频模式)；打嗝限流
U13 = LGS5116B: 功能类型:降压型;工作电压:4.5V~18V;输出电压:600mV~12V;输出电流:2A;输出类型:可调;; Manufacturer: Legend-Si(棱晶半导体); AddInBom: yes; ModelId: 18da8f6c14a34920b3e136b5c401a119聨0819f05c4eef4c71ace90d822a990e87; ModelName: SOT-23-6_L2.9-W1.6-H1.5-LS2.8-P0.95; ModelTransform: 110.73671,114.173,0,180,0,0,0.001,-0.003,0; Function: 降压型; Output Current: 2A; Frequency - Switching: 500kHz; Synchronous Rectifier: 是; Number of Outputs: 1; Topology: 降压式; Quiescent Current: 400uA; Switch tube (built-in/external): 内置; Output Type: 可调; Symbol: LGS5116B; Device: LGS5116B; LCSC Part Name: 降压型 2A 4.5V~18V; SupplierPart: C5818961; ManufacturerPart: LGS5116B; Supplier Footprint: SOT23-6; JLCPCB Part Class: Extended Part; Datasheet: https://item.szlcsc.com/datasheet/LGS5116B/6748671.html; Supplier: LCSC; ConvertToPcb: yes; FootprintName: SOT-23-6_L2.9-W1.6-P0.95-LS2.8-BR; Voltage - Supply: 4.5V~18V; Output Voltage: 600mV~12V; Operating Temperature: -40℃~+125℃@(TJ); Features: 轻载高效模式；逐波限流；过流保护
U14 = TLV7011DCKR: 比较器数:单路;输入失调电压(Vos):500uV;输入偏置电流(Ib):5pA;轨到轨:轨到轨输入;; Manufacturer: TI(德州仪器); AddInBom: yes; ModelId: 180ad2a85d044b18a9defb4b28abe560聨0819f05c4eef4c71ace90d822a990e87; ModelTransform: 78.74,86.614,0,0,0,0,-0.002,0.001,0; Number of Channels: 单路; Vos - Input Offset Voltage: 500uV; Ib - Input Bias Current: 5pA; Propagation Delay Time: 260ns; Input Hysteresis Voltage (Vhys): 4.2mV; Common Mode Rejection Ratio(CMRR): 78dB; Output Type: 推挽; Rail to Rail: 轨到轨输入; Quiescent Current: 5uA; Maximum Power Supply Range (Vdd-Vss): 6V; Single Supply: 1.6V~5.5V; Symbol: TLV7011DCKR; Device: TLV7011DCKR; LCSC Part Name: TLV7011和TLV7021小型、微功耗、低压比较器; SupplierPart: C193688; ManufacturerPart: TLV7011DCKR; Supplier Footprint: SC-70-5; JLCPCB Part Class: Extended Part; Datasheet: https://www.ti.com/cn/lit/ds/symlink/tlv7011.pdf; Supplier: LCSC; ConvertToPcb: yes; FootprintName: SC-70-5_L2.0-W1.3-P0.65-LS2.1-BL; ModelName: SC-70-5_L2.0-W1.3-P0.65-LS2.1-BL; Output Mode: -; Operating Temperature: -40℃~+125℃; Features: -
X2 = XKHEL89CGI-112YLC-32.768K: 晶振类型:贴片晶振;频率:32.768kHz;常温频差:±20ppm;负载电容:12.5pF;频率稳定度:-;; Manufacturer: YXC(扬兴晶振); AddInBom: yes; ModelId: 0ef12d2de4aa45edaecb2da3a0d0b794聨0819f05c4eef4c71ace90d822a990e87; ModelTransform: 78.74,47.244,0,0,0,0,0,0,0; Normal temperature Frequency Tolerance: ±20ppm; Load Capacitance: 12.5pF; Equivalent Series Resistance(ESR): 100kΩ; Symbol: XKHEL89CGI-112YLC-32.768K; Device: XKHEL89CGI-112YLC-32.768K; LCSC Part Name: YSX2012SK 32.768KHZ 2P 2012 12.5PF ±20PPM -40~85℃; SupplierPart: C7500573; ManufacturerPart: XKHEL89CGI-112YLC-32.768K; Supplier Footprint: SMD2012-2P; JLCPCB Part Class: Extended Part; Datasheet: https://item.szlcsc.com/datasheet/XKHEL89CGI-112YLC-32.768K/8579117.html; Supplier: LCSC; ConvertToPcb: yes; FootprintName: CRYSTAL-SMD_2P-L2.0-W1.2; ModelName: CRYSTAL-SMD_2P-L2.0-W1.2; Type: 贴片晶振; Value: 32.768kHz; Frequency Stability: -; Operating Temperature: -40℃~+85℃

## Sheet 串口 PHY.schdoc
size 297 x 209 mm; Symbol: Drawing-Symbol_A4; Company: 嘉立创EDA; Version: V1.0; Page Size: A4; @Project Name: RK3566; @Update Date: 2026-10-06; @Create Date: 2026-05-25; Device: Drawing-Symbol_A4; @Board Name: Board1; @Page Name: P2; @Create Time: 03:23:23; @Page Count: 10; @Page No: 10; @Schematic Name: Schematic1; @Update Time: 03:23:23; @Assembly Variant: Basic; Border: 1; Title Block Position: 3; Size: A4; Width: 1170; Height: 825; Region Start: 1; X Region Count: 6; Y Region Count: 4; Blade Width: 10; SheetNumber: 8; SheetTotal: 11
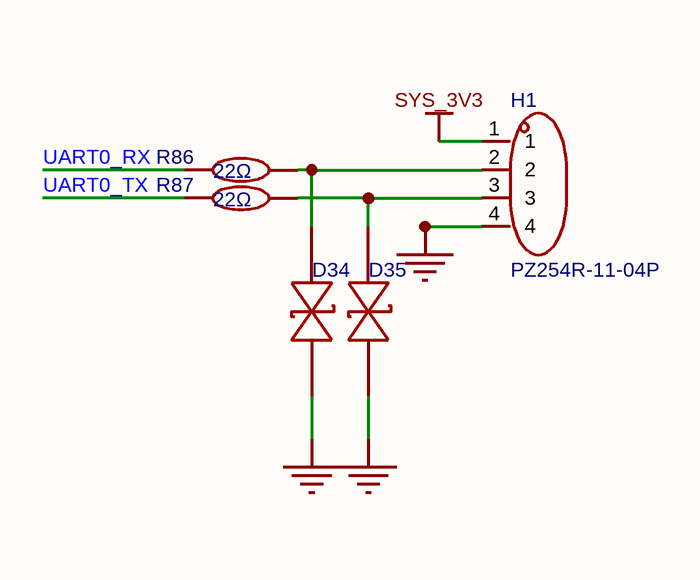
[diagram p9: 串口 PHY.schdoc]

### Parts
D34  BDFN1C051R  [DFN0603-D_L0.6-W0.3-P0.34-BI]  (value not drawn)
D35  BDFN1C051R  [DFN0603-D_L0.6-W0.3-P0.34-BI]  (value not drawn)
H1  PZ254R-11-04P  [HDR-TH_4P-P2.54-H-M-W10.4]
R86  22Ω  [R0402]
R87  22Ω  [R0402]

### Nets
GND: D34.1 D35.1 H1.4  [project net AVSS1_1]
SYS_3V3: H1.1
UART0_RX: R86.1
UART0_TX: R87.1
NetD34_2: D34.2 H1.2 R86.2
NetD35_2: D35.2 H1.3 R87.2

### Notes on the sheet
- 创建日期
- 2026-10-06
- 原理图
- 板子
- Schematic1
- Board1
- 更新日期
- 图页
- P2
- 绘制
- 审阅
- RK3566
- 版本
- V1.0
- 尺寸
- A4
- 页    10    共    10
- 嘉立创EDA

### Library data of the parts
D34 D35 = BDFN1C051R: 极性:双向;反向截止电压(Vrwm):5V;钳位电压:13V;峰值脉冲电流(Ipp):4A@8/20us;击穿电压(VBR):5.5V;; Manufacturer: BORN(伯恩半导体); 3D Model: 295ccb0e91f84fca9fcc42e8f031306b聨0819f05c4eef4c71ace90d822a990e87; 3D Model Transform: 24.0157,12.2047,0,0,0,0,0,0,0; Polarity: 双向; Reverse Stand-Off Voltage (Vrwm): 5V; Clamping Voltage: 13V; Voltage - Breakdown: 5.5V; Reverse Leakage Current (Ir): 100nA; Number of Channels: 单路; level of protection: IEC 61000-4-4；IEC 61000-4-5；IEC 61000-4-2; Type: ESD; Junction Capacitance: 0.2pF; AddInBom: yes; ModelName: DFN0603-D_L0.6-W0.3--H0.3-P0.34-BI; Symbol: BDFN1C051R; Device: BDFN1C051R; LCSC Part Name: 双向ESD 5V截止 峰值脉冲电流：4A@8/20us; Supplier Part: C152032; Manufacturer Part: BDFN1C051R; Supplier Footprint: DFN0603-D; JLCPCB Part Class: Extended Part; Datasheet: https://item.szlcsc.com/datasheet/BDFN1C051R/163372.html; Supplier: LCSC; Peak Pulse Current (Ipp): 4A@8/20us; ConvertToPcb: yes; FootprintName: DFN0603-D_L0.6-W0.3-P0.34-BI
H1 = PZ254R-11-04P: 插针结构:1x4P;间距:2.54mm;行距:-;圆针/方针:方针;安装方式:弯插;排数:单排;总PIN位数:4P;额定电流:3A;额定电压:250V;配合针长度:6mm;塑高:2.5mm;端接针长度:-;触头材质:黄铜;触头镀层:-;工作温度:-40℃~+105℃;颜色:黑色;; Manufacturer: XFCN(兴飞); AddInBom: yes; ModelId: d6c429cf28314298a2074cefd68172f0聨0819f05c4eef4c71ace90d822a990e87; ModelName: HDR-TH_4P-P2.54-M-WI-1X4P; ModelTransform: 399.999,417.322,0,180,0,0,0,-196.85,-118.11; Pin Structure: 1x4P; Pitch: 2.54mm; Circluar Pins/Square Pins: 方针; Current Rating: 3A; Voltage Rating (Max): 250V; Symbol: PZ254R-11-04P; Device: PZ254R-11-04P; LCSC Part Name: 1x4P 间距:2.54mm 方针 弯插; SupplierPart: C492412; ManufacturerPart: PZ254R-11-04P; Supplier Footprint: 弯插,P=2.54mm; JLCPCB Part Class: Extended Part; Datasheet: https://item.szlcsc.com/datasheet/PZ254R-11-04P/502968.html; Supplier: LCSC; ConvertToPcb: yes; FootprintName: HDR-TH_4P-P2.54-H-M-W10.4; Row Spacing: -; Mounting Type: 弯插; Number of Rows: 单排; Number of Pins: 4P; Length of Mating Pin: 6mm; Insulation Height: 2.5mm; Length of End Connection Pin: -; Contact Material: 黄铜; Contact Plating: -; Operating Temperature: -40℃~+105℃; Color: 黑色
R86 R87 = 0402WGF220JTCE: 电阻类型:厚膜电阻;阻值:22Ω;精度:±1%;功率:62.5mW;最大工作电压:50V;温度系数:±100ppm/℃;; Manufacturer: UNI-ROYAL(厚声); AddInBom: yes; ModelId: 98c88bc2b9094f218f3a3e30a7012738聨0819f05c4eef4c71ace90d822a990e87; ModelName: R0402_L1.0-W0.5-H0.4; ModelTransform: 39.37,19.685,0,0,0,0,0,0,0; Tolerance: ±1%; Power(Watts): 62.5mW; Overload Voltage (Max): 50V; Symbol: 0402WGF220JTCE; Device: 0402WGF220JTCE; LCSC Part Name: 22Ω ±1% 62.5mW 厚膜电阻; SupplierPart: C25092; ManufacturerPart: 0402WGF220JTCE; Supplier Footprint: 0402; JLCPCB Part Class: Basic Part; Datasheet: https://atta.szlcsc.com/upload/public/pdf/source/20200306/C422600_1E6D84923E4A46A82E41ADD87F860B5C.pdf; Supplier: LCSC; ConvertToPcb: yes; FootprintName: R0402; Type: 厚膜电阻; Value: 22Ω; Temperature Coefficient: ±100ppm/℃; Operating Temperature Range: -55℃~+155℃

## Sheet 扬声器_麦克风.schdoc
size 297 x 209 mm; Symbol: Drawing-Symbol_A4; Company: 嘉立创EDA; Version: V1.0; Page Size: A4; @Project Name: RK3566; @Update Date: 2026-10-03; @Create Date: 2026-05-25; Device: Drawing-Symbol_A4; @Board Name: Board1; @Page Name: P2; @Create Time: 01:28:12; @Page Count: 3; @Page No: 3; @Schematic Name: Schematic1; @Update Time: 01:28:12; @Assembly Variant: Basic; Border: 1; Title Block Position: 3; Size: A4; Width: 1170; Height: 825; Region Start: 1; X Region Count: 6; Y Region Count: 4; Blade Width: 10; SheetNumber: 9; SheetTotal: 11
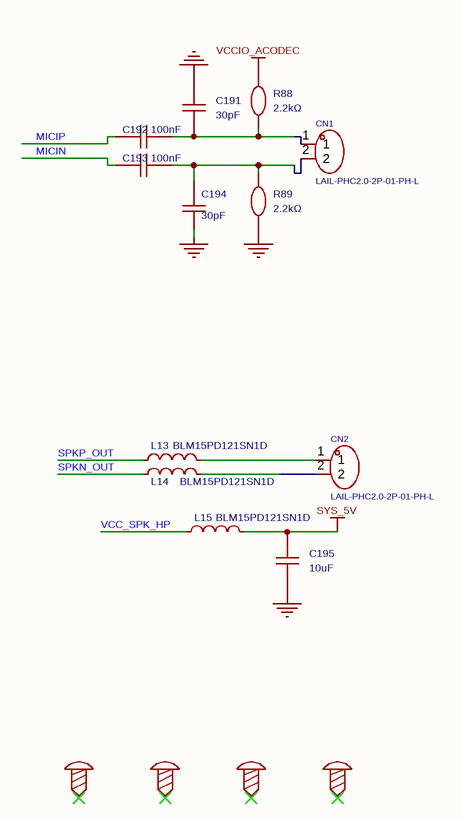
[diagram p10: 扬声器_麦克风.schdoc]

### Parts
C191  30pF  [C0402]
C192  100nF  [C0402]
C193  100nF  [C0402]
C194  30pF  [C0402]
C195  10uF  [C0402]
CN1  LAIL-PHC2.0-2P-01-PH-L  [CONN-TH_2P-P2.00_HC-PH-2A-TW]
CN2  LAIL-PHC2.0-2P-01-PH-L  [CONN-TH_2P-P2.00_HC-PH-2A-TW]
L13  BLM15PD121SN1D  [L0402]
L14  BLM15PD121SN1D  [L0402]
L15  BLM15PD121SN1D  [L0402]
R88  2.2kΩ  [R0402]
R89  2.2kΩ  [R0402]
SCREW1  (no value)  [M3螺丝]
SCREW2  (no value)  [M3螺丝]
SCREW3  (no value)  [M3螺丝]
SCREW4  (no value)  [M3螺丝]

### Nets
GND: C191.2 C194.1 C195.1 R89.1  [project net AVSS1_1]
SYS_5V: C195.2 L15.2
VCCIO_ACODEC: R88.2  [project net LDO4]
MICIN: C193.1
MICIP: C192.1
SPKN_OUT: L14.1
SPKP_OUT: L13.1
VCC_SPK_HP: L15.1
NetC191_1: C191.1 C192.2 CN1.1 R88.1
NetC193_2: C193.2 C194.2 CN1.2 R89.2
NetCN2_1: CN2.1 L13.2
NetCN2_2: CN2.2 L14.2

Not connected (* = marked no-connect by the designer): SCREW1 1*; SCREW2 1*; SCREW3 1*; SCREW4 1*

### Notes on the sheet
- 创建日期
- 2026-10-03
- 原理图
- 板子
- Schematic1
- Board1
- 更新日期
- 图页
- P2
- 绘制
- 审阅
- RK3566
- 版本
- V1.0
- 尺寸
- A4
- 页    3    共    3
- 嘉立创EDA

### Library data of the parts
C191 C194 = CC0402FRNPO9BN300: as C111 on sheet WIFI_BT PHY; Symbol: CC0402FRNPO9BN300; Device: CC0402FRNPO9BN300; LCSC Part Name: 30pF ±1% 50V; SupplierPart: C526980; ManufacturerPart: CC0402FRNPO9BN300; Supplier Footprint: 0402; JLCPCB Part Class: Extended Part; Datasheet: https://atta.szlcsc.com/upload/public/pdf/source/20200508/C526980_8BD9B2380CFF3BD9993DEB032B356E9B.pdf; Supplier: LCSC; ConvertToPcb: yes; FootprintName: C0402; Value: 30pF
C192 C193 = FCC0402B104K160AT: 容值:100nF;精度:±10%;额定电压:16V;温度系数:X7R;; Manufacturer: FOJAN(富捷); AddInBom: yes; ModelId: 36a51122f27c49738f86b3bfa98863e0聨0819f05c4eef4c71ace90d822a990e87; ModelName: C0402_L1.0-W0.5-H0.5; ModelTransform: 39.37,19.685,0,0,0,0,0,0,0; Tolerance: ±10%; Voltage Rating: 16V; Temperature Coefficient: X7R; Symbol: FCC0402B104K160AT; Device: FCC0402B104K160AT; LCSC Part Name: 100nF ±10% 16V; SupplierPart: C5137468; ManufacturerPart: FCC0402B104K160AT; Supplier Footprint: 0402; JLCPCB Part Class: Extended Part; Datasheet: https://item.szlcsc.com/datasheet/FCC0402B104K160AT/5746970.html; Supplier: LCSC; ConvertToPcb: yes; FootprintName: C0402; Value: 100nF; Operating Temperature: -55℃~+125℃
C195 = HGC0402R5106M100NTEJ: as C118 on sheet WIFI_BT PHY; Symbol: HGC0402R5106M100NTEJ; Device: HGC0402R5106M100NTEJ; LCSC Part Name: 10uF ±20% 10V; Supplier Part: C7472949; Manufacturer Part: HGC0402R5106M100NTEJ; Supplier Footprint: 0402; JLCPCB Part Class: Extended Part; Datasheet: https://item.szlcsc.com/datasheet/HGC0402R5106M100NTEJ/8532796.html; Supplier: LCSC; Value: 10uF; ConvertToPcb: yes; FootprintName: C0402
CN1 CN2 = LAIL-PHC2.0-2P-01-PH-L: 插针结构:1x2P;间距:2mm;安装方式:直插;参考系列:PH;总PIN数:2P;排数:1;每排PIN数:2;额定电流:2A;触头材质:黄铜;触头镀层:锡;工作温度:-25℃~+85℃;; Manufacturer: LAILAN(莱联); AddInBom: yes; ModelId: 5b53f0660d4141229bca89eb4238f4a6聨0819f05c4eef4c71ace90d822a990e87; ModelTransform: 236.22,189.3697,0,180,0,0,0,25.591,-133.858; Pins Structure: 1x2P; Pitch: 2mm; Reference Series: PH; Number of PINs Per Row: 2; Current Rating: 2A; Voltage Rating: 250V; Plastic Material: PA66; Flame Retardant Rating: UL94V-0; Z-Height of the Board: 6mm; Y-Width of Bottom Edge on Board: 4.7mm; Symbol: LAIL-PHC2.0-2P-01-PH-L; Device: LAIL-PHC2.0-2P-01-PH-L; LCSC Part Name: 1x2P 间距:2mm 直插 系列:PH; SupplierPart: C54905988; ManufacturerPart: LAIL-PHC2.0-2P-01-PH-L; Supplier Footprint: 插件,P=2mm; JLCPCB Part Class: Extended Part; Datasheet: https://item.szlcsc.com/datasheet/LAIL-PHC2.0-2P-01-PH-L/58431115.html; Supplier: LCSC; ConvertToPcb: yes; FootprintName: CONN-TH_2P-P2.00_HC-PH-2A-TW; ModelName: CONN-TH_2P-P2.00_HC-PH-2A-TW; Mounting Type: 直插; Number of Pins: 2P; Number of Rows: 1; Contact Material: 黄铜; Contact Plating: 锡; Operating Temperature: -25℃~+85℃; Color: 白色; X-Length of Bottom Edge on Board (Spacing Line): 6mm
L13-L15 = BLM15PD121SN1D: 阻抗@频率:120Ω@100MHz;误差:±25%;直流电阻(DCR):90mΩ;; Manufacturer: muRata(村田); AddInBom: yes; ModelId: d8d36575a3234d4790bfa765c88664a7聨0819f05c4eef4c71ace90d822a990e87; ModelName: L0402_L1.0-W0.5-H0.5_BEAD; ModelTransform: 39.37,19.685,0,0,0,0,0,0.0005,0; Tolerance: ±25%; DC Resistance(DCR): 90mΩ; Current Rating: 1.3A; Number of Circuits: 1; Symbol: BLM15PD121SN1D; Device: BLM15PD121SN1D; LCSC Part Name: 单路 0402磁珠 阻抗120Ω@100MHz; SupplierPart: C76891; ManufacturerPart: BLM15PD121SN1D; Supplier Footprint: 0402; JLCPCB Part Class: Extended Part; Datasheet: https://item.szlcsc.com/datasheet/BLM15PD121SN1D/78018.html; Supplier: LCSC; ConvertToPcb: yes; FootprintName: L0402; Impedance @ Frequency: 120Ω@100MHz; Operating Temperature: -55℃~+125℃
R88 R89 = FRC0402F2201TS: 电阻类型:厚膜电阻;阻值:2.2kΩ;精度:±1%;功率:62.5mW;工作电压:50V;温度系数:±100ppm/℃;; Manufacturer: FOJAN(富捷); AddInBom: yes; ModelId: 98c88bc2b9094f218f3a3e30a7012738聨0819f05c4eef4c71ace90d822a990e87; ModelName: R0402_L1.0-W0.5-H0.4; ModelTransform: 39.37,19.685,0,0,0,0,0,0,0; Tolerance: ±1%; Power(Watts): 62.5mW; Voltage-Supply(Max): 50V; Symbol: FRC0402F2201TS; Device: FRC0402F2201TS; LCSC Part Name: 2.2kΩ ±1% 62.5mW 厚膜电阻; SupplierPart: C2906865; ManufacturerPart: FRC0402F2201TS; Supplier Footprint: 0402; JLCPCB Part Class: Extended Part; Datasheet: https://item.szlcsc.com/datasheet/FRC0402F2201TS/3180378.html; Supplier: LCSC; ConvertToPcb: yes; FootprintName: R0402; Type: 厚膜电阻; Value: 2.2kΩ; Temperature Coefficient: ±100ppm/℃; Operating Temperature: -55℃~+155℃
SCREW1-SCREW4 = M3螺丝: Symbol: 螺丝孔; ConvertToPcb: yes; Device: M3螺丝; AddInBom: yes; Supplier Footprint: 插件; FootprintName: M3螺丝